# Altium schematic sheet DDR3.SchDoc
size A4; SheetNumber: 4; SheetTotal: 11
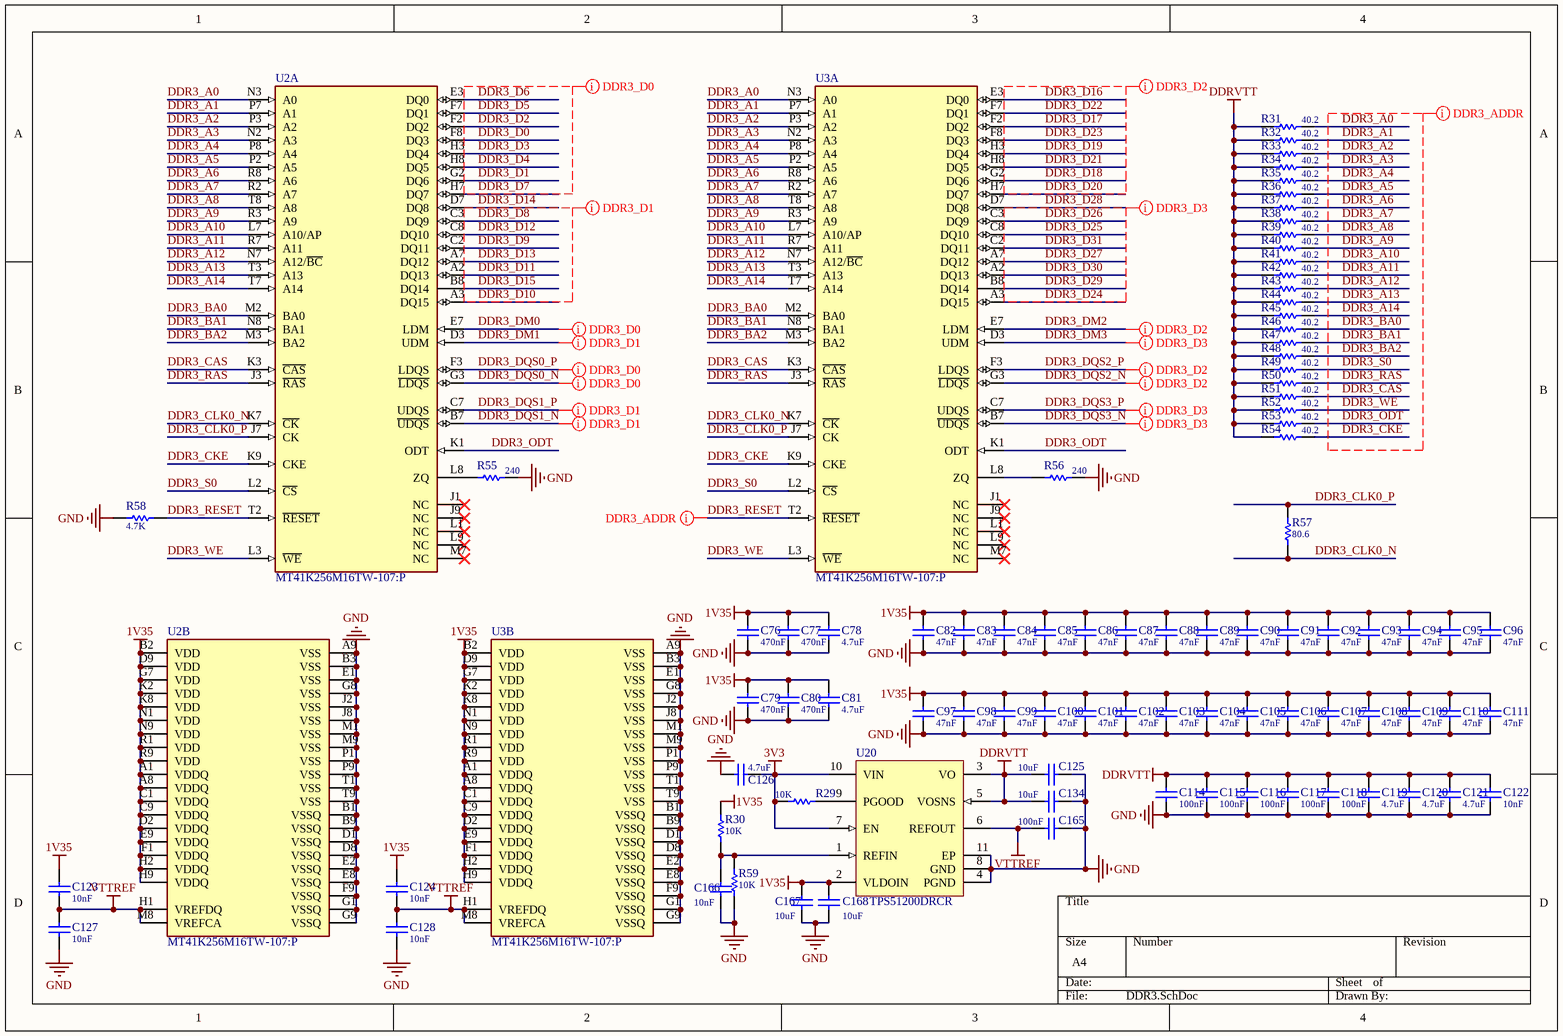
[diagram p0: DDR3.SchDoc]

## Parts
C76  value 470nF  [C0402-L]  (hidden comment: Cap-S)
C77  value 470nF  [C0402-L]  (hidden comment: Cap-S)
C78  value 4.7uF  [C0402-L]  (hidden comment: Cap-S)
C79  value 470nF  [C0402-L]  (hidden comment: Cap-S)
C80  value 470nF  [C0402-L]  (hidden comment: Cap-S)
C81  value 4.7uF  [C0402-L]  (hidden comment: Cap-S)
C82  value 47nF  [C0402-L]  (hidden comment: Cap-S)
C83  value 47nF  [C0402-L]  (hidden comment: Cap-S)
C84  value 47nF  [C0402-L]  (hidden comment: Cap-S)
C85  value 47nF  [C0402-L]  (hidden comment: Cap-S)
C86  value 47nF  [C0402-L]  (hidden comment: Cap-S)
C87  value 47nF  [C0402-L]  (hidden comment: Cap-S)
C88  value 47nF  [C0402-L]  (hidden comment: Cap-S)
C89  value 47nF  [C0402-L]  (hidden comment: Cap-S)
C90  value 47nF  [C0402-L]  (hidden comment: Cap-S)
C91  value 47nF  [C0402-L]  (hidden comment: Cap-S)
C92  value 47nF  [C0402-L]  (hidden comment: Cap-S)
C93  value 47nF  [C0402-L]  (hidden comment: Cap-S)
C94  value 47nF  [C0402-L]  (hidden comment: Cap-S)
C95  value 47nF  [C0402-L]  (hidden comment: Cap-S)
C96  value 47nF  [C0402-L]  (hidden comment: Cap-S)
C97  value 47nF  [C0402-L]  (hidden comment: Cap-S)
C98  value 47nF  [C0402-L]  (hidden comment: Cap-S)
C99  value 47nF  [C0402-L]  (hidden comment: Cap-S)
C100  value 47nF  [C0402-L]  (hidden comment: Cap-S)
C101  value 47nF  [C0402-L]  (hidden comment: Cap-S)
C102  value 47nF  [C0402-L]  (hidden comment: Cap-S)
C103  value 47nF  [C0402-L]  (hidden comment: Cap-S)
C104  value 47nF  [C0402-L]  (hidden comment: Cap-S)
C105  value 47nF  [C0402-L]  (hidden comment: Cap-S)
C106  value 47nF  [C0402-L]  (hidden comment: Cap-S)
C107  value 47nF  [C0402-L]  (hidden comment: Cap-S)
C108  value 47nF  [C0402-L]  (hidden comment: Cap-S)
C109  value 47nF  [C0402-L]  (hidden comment: Cap-S)
C110  value 47nF  [C0402-L]  (hidden comment: Cap-S)
C111  value 47nF  [C0402-L]  (hidden comment: Cap-S)
C114  value 100nF  [C0402-L]  (hidden comment: Cap-S)
C115  value 100nF  [C0402-L]  (hidden comment: Cap-S)
C116  value 100nF  [C0402-L]  (hidden comment: Cap-S)
C117  value 100nF  [C0402-L]  (hidden comment: Cap-S)
C118  value 100nF  [C0402-L]  (hidden comment: Cap-S)
C119  value 4.7uF  [C0402-L]  (hidden comment: Cap-S)
C120  value 4.7uF  [C0402-L]  (hidden comment: Cap-S)
C121  value 4.7uF  [C0402-L]  (hidden comment: Cap-S)
C122  value 10nF  [C0402-L]  (hidden comment: Cap-S)
C123  value 10nF  [C0402-L]  (hidden comment: Cap-S)
C124  value 10nF  [C0402-L]  (hidden comment: Cap-S)
C125  value 10uF  [C0603-L]  (hidden comment: Cap-S)
C126  value 4.7uF  [C0603-L]  (hidden comment: Cap-S)
C127  value 10nF  [C0402-L]  (hidden comment: Cap-S)
C128  value 10nF  [C0402-L]  (hidden comment: Cap-S)
C134  value 10uF  [C0603-L]  (hidden comment: Cap-S)
C165  value 100nF  [C0402-L]  (hidden comment: Cap-S)
C166  value 10nF  [C0402-L]  (hidden comment: Cap-S)
C167  value 10uF  [C0603-L]  (hidden comment: Cap-S)
C168  value 10uF  [C0603-L]  (hidden comment: Cap-S)
R29  value 10K  [R0402-L]  (hidden comment: R)
R30  value 10K  [R0402-L]  (hidden comment: R)
R31  value 40.2  [R0402-L]  (hidden comment: R)
R32  value 40.2  [R0402-L]  (hidden comment: R)
R33  value 40.2  [R0402-L]  (hidden comment: R)
R34  value 40.2  [R0402-L]  (hidden comment: R)
R35  value 40.2  [R0402-L]  (hidden comment: R)
R36  value 40.2  [R0402-L]  (hidden comment: R)
R37  value 40.2  [R0402-L]  (hidden comment: R)
R38  value 40.2  [R0402-L]  (hidden comment: R)
R39  value 40.2  [R0402-L]  (hidden comment: R)
R40  value 40.2  [R0402-L]  (hidden comment: R)
R41  value 40.2  [R0402-L]  (hidden comment: R)
R42  value 40.2  [R0402-L]  (hidden comment: R)
R43  value 40.2  [R0402-L]  (hidden comment: R)
R44  value 40.2  [R0402-L]  (hidden comment: R)
R45  value 40.2  [R0402-L]  (hidden comment: R)
R46  value 40.2  [R0402-L]  (hidden comment: R)
R47  value 40.2  [R0402-L]  (hidden comment: R)
R48  value 40.2  [R0402-L]  (hidden comment: R)
R49  value 40.2  [R0402-L]  (hidden comment: R)
R50  value 40.2  [R0402-L]  (hidden comment: R)
R51  value 40.2  [R0402-L]  (hidden comment: R)
R52  value 40.2  [R0402-L]  (hidden comment: R)
R53  value 40.2  [R0402-L]  (hidden comment: R)
R54  value 40.2  [R0402-L]  (hidden comment: R)
R55  value 240  [R0402-L]  (hidden comment: R)
R56  value 240  [R0402-L]  (hidden comment: R)
R57  value 80.6  [R0402-L]  (hidden comment: R)
R58  value 4.7K  [R0402-L]  (hidden comment: R)
R59  value 10K  [R0402-L]  (hidden comment: R)
U2  MT41K256M16TW-107:P  [FP-TW-IPC_C]  (parts A,B of 2)
U3  MT41K256M16TW-107:P  [FP-TW-IPC_C]  (parts A,B of 2)
U20  TPS51200DRCR  [DRC0010J_V]

## Nets
1V35: C76.2 C77.2 C78.2 C79.2 C80.2 C81.2 C82.2 C83.2 C84.2 C85.2 C86.2 C87.2 C88.2 C89.2 C90.2 C91.2 C92.2 C93.2 C94.2 C95.2 C96.2 C97.2 C98.2 C99.2 C100.2 C101.2 C102.2 C103.2 C104.2 C105.2 C106.2 C107.2 C108.2 C109.2 C110.2 C111.2 C123.2 C124.2 C167.1 C168.1 R30.2 U2.A1(VDDQ) U2.A8(VDDQ) U2.B2(VDD) U2.C1(VDDQ) U2.C9(VDDQ) U2.D2(VDDQ) U2.D9(VDD) U2.E9(VDDQ) U2.F1(VDDQ) U2.G7(VDD) U2.H2(VDDQ) U2.H9(VDDQ) U2.K2(VDD) U2.K8(VDD) U2.N1(VDD) U2.N9(VDD) U2.R1(VDD) U2.R9(VDD) U3.A1(VDDQ) U3.A8(VDDQ) U3.B2(VDD) U3.C1(VDDQ) U3.C9(VDDQ) U3.D2(VDDQ) U3.D9(VDD) U3.E9(VDDQ) U3.F1(VDDQ) U3.G7(VDD) U3.H2(VDDQ) U3.H9(VDDQ) U3.K2(VDD) U3.K8(VDD) U3.N1(VDD) U3.N9(VDD) U3.R1(VDD) U3.R9(VDD) U20.2(VLDOIN)
3V3: C126.1 R29.2 U20.7(EN) U20.10(VIN)
DDRVTT: C114.2 C115.2 C116.2 C117.2 C118.2 C119.2 C120.2 C121.2 C122.2 C125.1 C134.1 R31.1 R32.1 R33.1 R34.1 R35.1 R36.1 R37.1 R38.1 R39.1 R40.1 R41.1 R42.1 R43.1 R44.1 R45.1 R46.1 R47.1 R48.1 R49.1 R50.1 R51.1 R52.1 R53.1 R54.1 U20.3(VO) U20.5(VOSNS)
GND: C76.1 C77.1 C78.1 C79.1 C80.1 C81.1 C82.1 C83.1 C84.1 C85.1 C86.1 C87.1 C88.1 C89.1 C90.1 C91.1 C92.1 C93.1 C94.1 C95.1 C96.1 C97.1 C98.1 C99.1 C100.1 C101.1 C102.1 C103.1 C104.1 C105.1 C106.1 C107.1 C108.1 C109.1 C110.1 C111.1 C114.1 C115.1 C116.1 C117.1 C118.1 C119.1 C120.1 C121.1 C122.1 C125.2 C126.2 C127.1 C128.1 C134.2 C165.2 C166.2 C167.2 C168.2 R55.2 R56.2 R58.2 R59.1 U2.A9(VSS) U2.B1(VSSQ) U2.B3(VSS) U2.B9(VSSQ) U2.D1(VSSQ) U2.D8(VSSQ) U2.E1(VSS) U2.E2(VSSQ) U2.E8(VSSQ) U2.F9(VSSQ) U2.G1(VSSQ) U2.G8(VSS) U2.G9(VSSQ) U2.J2(VSS) U2.J8(VSS) U2.M1(VSS) U2.M9(VSS) U2.P1(VSS) U2.P9(VSS) U2.T1(VSS) U2.T9(VSS) U3.A9(VSS) U3.B1(VSSQ) U3.B3(VSS) U3.B9(VSSQ) U3.D1(VSSQ) U3.D8(VSSQ) U3.E1(VSS) U3.E2(VSSQ) U3.E8(VSSQ) U3.F9(VSSQ) U3.G1(VSSQ) U3.G8(VSS) U3.G9(VSSQ) U3.J2(VSS) U3.J8(VSS) U3.M1(VSS) U3.M9(VSS) U3.P1(VSS) U3.P9(VSS) U3.T1(VSS) U3.T9(VSS) U20.4(PGND) U20.8(GND) U20.11(EP)
VTTREF: C123.1 C124.1 C127.2 C128.2 C165.1 U2.H1(VREFDQ) U2.M8(VREFCA) U3.H1(VREFDQ) U3.M8(VREFCA) U20.6(REFOUT)
DDR3_A0: R31.2 U2.N3(A0) U3.N3(A0)
DDR3_A1: R32.2 U2.P7(A1) U3.P7(A1)
DDR3_A2: R33.2 U2.P3(A2) U3.P3(A2)
DDR3_A3: R34.2 U2.N2(A3) U3.N2(A3)
DDR3_A4: R35.2 U2.P8(A4) U3.P8(A4)
DDR3_A5: R36.2 U2.P2(A5) U3.P2(A5)
DDR3_A6: R37.2 U2.R8(A6) U3.R8(A6)
DDR3_A7: R38.2 U2.R2(A7) U3.R2(A7)
DDR3_A8: R39.2 U2.T8(A8) U3.T8(A8)
DDR3_A9: R40.2 U2.R3(A9) U3.R3(A9)
DDR3_A10: R41.2 U2.L7(A10/AP) U3.L7(A10/AP)
DDR3_A11: R42.2 U2.R7(A11) U3.R7(A11)
DDR3_A12: R43.2 U2.N7(A12/~{BC}) U3.N7(A12/~{BC})
DDR3_A13: R44.2 U2.T3(A13) U3.T3(A13)
DDR3_A14: R45.2 U2.T7(A14) U3.T7(A14)
DDR3_BA0: R46.2 U2.M2(BA0) U3.M2(BA0)
DDR3_BA1: R47.2 U2.N8(BA1) U3.N8(BA1)
DDR3_BA2: R48.2 U2.M3(BA2) U3.M3(BA2)
DDR3_CAS: R51.2 U2.K3(~{CAS}) U3.K3(~{CAS})
DDR3_CKE: R54.2 U2.K9(CKE) U3.K9(CKE)
DDR3_CLK0_N: R57.1 U2.K7(~{CK}) U3.K7(~{CK})
DDR3_CLK0_P: R57.2 U2.J7(CK) U3.J7(CK)
DDR3_D0: U2.F8(DQ3)
DDR3_D1: U2.G2(DQ6)
DDR3_D2: U2.F2(DQ2)
DDR3_D3: U2.H3(DQ4)
DDR3_D4: U2.H8(DQ5)
DDR3_D5: U2.F7(DQ1)
DDR3_D6: U2.E3(DQ0)
DDR3_D7: U2.H7(DQ7)
DDR3_D8: U2.C3(DQ9)
DDR3_D9: U2.C2(DQ11)
DDR3_D10: U2.A3(DQ15)
DDR3_D11: U2.A2(DQ13)
DDR3_D12: U2.C8(DQ10)
DDR3_D13: U2.A7(DQ12)
DDR3_D14: U2.D7(DQ8)
DDR3_D15: U2.B8(DQ14)
DDR3_D16: U3.E3(DQ0)
DDR3_D17: U3.F2(DQ2)
DDR3_D18: U3.G2(DQ6)
DDR3_D19: U3.H3(DQ4)
DDR3_D20: U3.H7(DQ7)
DDR3_D21: U3.H8(DQ5)
DDR3_D22: U3.F7(DQ1)
DDR3_D23: U3.F8(DQ3)
DDR3_D24: U3.A3(DQ15)
DDR3_D25: U3.C8(DQ10)
DDR3_D26: U3.C3(DQ9)
DDR3_D27: U3.A7(DQ12)
DDR3_D28: U3.D7(DQ8)
DDR3_D29: U3.B8(DQ14)
DDR3_D30: U3.A2(DQ13)
DDR3_D31: U3.C2(DQ11)
DDR3_DM0: U2.E7(LDM)
DDR3_DM1: U2.D3(UDM)
DDR3_DM2: U3.E7(LDM)
DDR3_DM3: U3.D3(UDM)
DDR3_DQS0_N: U2.G3(~{LDQS})
DDR3_DQS0_P: U2.F3(LDQS)
DDR3_DQS1_N: U2.B7(~{UDQS})
DDR3_DQS1_P: U2.C7(UDQS)
DDR3_DQS2_N: U3.G3(~{LDQS})
DDR3_DQS2_P: U3.F3(LDQS)
DDR3_DQS3_N: U3.B7(~{UDQS})
DDR3_DQS3_P: U3.C7(UDQS)
DDR3_ODT: R53.2 U2.K1(ODT) U3.K1(ODT)
DDR3_RAS: R50.2 U2.J3(~{RAS}) U3.J3(~{RAS})
DDR3_RESET: R58.1 U2.T2(~{RESET}) U3.T2(~{RESET})
DDR3_S0: R49.2 U2.L2(~{CS}) U3.L2(~{CS})
DDR3_WE: R52.2 U2.L3(~{WE}) U3.L3(~{WE})
NetC166_1: C166.1 R30.1 R59.2 U20.1(REFIN)
NetR29_1: R29.1 U20.9(PGOOD)
NetR55_1: R55.1 U2.L8(ZQ)
NetR56_1: R56.1 U3.L8(ZQ)

Not connected (* = marked no-connect by the designer): U2 J1(NC)* J9(NC)* L1(NC)* L9(NC)* M7(NC)*; U3 J1(NC)* J9(NC)* L1(NC)* L9(NC)* M7(NC)*

## Layout directives
net class DDR3_ADDR: DDR3_A0, DDR3_A1, DDR3_A2, DDR3_A3, DDR3_A4, DDR3_A5, DDR3_A6, DDR3_A7, DDR3_A8, DDR3_A9, DDR3_A10, DDR3_A11, DDR3_A12, DDR3_A13, DDR3_A14, DDR3_BA0, DDR3_BA1, DDR3_BA2, DDR3_CAS, DDR3_CKE, DDR3_ODT, DDR3_RAS, DDR3_RESET, DDR3_S0, DDR3_WE
net class DDR3_D0: DDR3_D0, DDR3_D1, DDR3_D2, DDR3_D3, DDR3_D4, DDR3_D5, DDR3_D6, DDR3_D7, DDR3_DM0, DDR3_DQS0_N, DDR3_DQS0_P
net class DDR3_D1: DDR3_D8, DDR3_D9, DDR3_D10, DDR3_D11, DDR3_D12, DDR3_D13, DDR3_D14, DDR3_D15, DDR3_DM1, DDR3_DQS1_N, DDR3_DQS1_P
net class DDR3_D2: DDR3_D16, DDR3_D17, DDR3_D18, DDR3_D19, DDR3_D20, DDR3_D21, DDR3_D22, DDR3_D23, DDR3_DM2, DDR3_DQS2_N, DDR3_DQS2_P
net class DDR3_D3: DDR3_D28, DDR3_DM3, DDR3_DQS3_N, DDR3_DQS3_P

## Library data of the parts
C76-C111 C114-C128 C134 C165-C168 = Cap-S: 贴片瓷片电容
R29-R59 = Res: 贴片电阻
U2 U3 = CMP-2000-07475-2: IC DRAM 4G PARALLEL 96FBGA; Manufacturer: Micron; Access Time: 1.07ns; Nominal Supply Current: 12-156mA; Min Supply Voltage: 1.283V; Memory Type: SDRAM,DDR3; Standoff Height: 0.29mm; Max Supply Voltage: 1.45V; Memory Size: 4Gbits; Device Class L1: Integrated Circuits (ICs); Lead Free: Yes; ComponentLink2Description: Datasheet; Manufacturer Part Number: MT41K256M16TW-107:P; Category: IC; Digikey Description: IC DRAM 4G PARALLEL 96FBGA; Device Class L3: RAM; Interface: Parallel; RoHS: TRUE; Octopart: https://octopart.com/mt41k256m16tw-107%3Ap-micron-66533852; Temperature Range High: +85°C; ComponentLink2URL: https://www.micron.com/-/media/client/global/documents/products/data-sheet/dram/ddr3/4gb_ddr3l.pdf; Temperature: 0°C to +85°C; Package: TW; Device Class L2: Memory; Automotive: No; Height: 1.2mm; Temperature Range Low: 0°C
U20 = CMP-0395-00664-2: Single Output LDO, 3 A, 2.375 to 3.5 V Input, with DDR Termination, 10-pin SON (DRC), -40 to 85 degC, Green (RoHS & no Sb/Br); Manufacturer: Texas Instruments; Vin(Min)(V): 2.3; Vin(Max)(V): 3.5; SubFamily: Single Channel LDO; Iout(Max)(A): 3; Power Good: TRUE; Iq(Typ)(mA): 0.5; Rating: Catalog; ComponentLink1URL: http://www.ti.com/; ComponentLink3URL: http://www.ti.com/litv/pdf/mpds117k; PackageVersion: 4204102-3/L; Mounting Technology: Surface Mount; DatasheetVersion: SLUS812; Eco-Plan: Green (RoHS & no Sb/Br); ComponentLink4URL: Samples URL:http://www.ti.com/product/tps51200#samples; ComponentLink3Description: Package Specification; PackageReference: DRC0010J; ComponentLink2URL: http://www.ti.com/general/docs/lit/getliterature.tsp?genericPartNumber=TPS51200&fileType=pdf; ComponentLink2Description: Datasheet; PartNumber: TPS51200DRCR; PackageDescription: 10-Pin Plastic Small Outline, Body 3 x 3 mm, Pitch 0.5 mm; ComponentLink4Description: URL Link1; ComponentLink1Description: Manufacturer URL